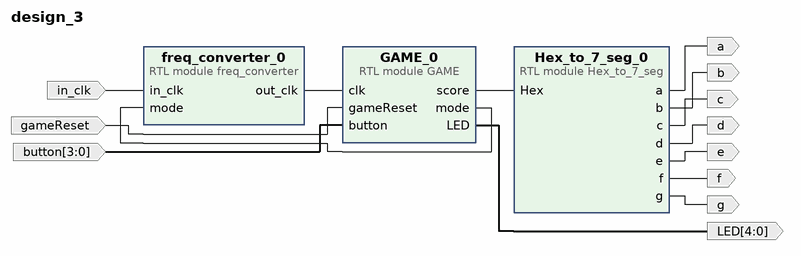
[diagram p0: block diagram of the top level]
# Vivado block design design_3, xc7z010clg400-1, Vivado 2019.1
create_bd_design design_3

create_bd_port -dir I -type clk in_clk
create_bd_port -dir O -from 4 -to 0 LED
create_bd_port -dir I gameReset
create_bd_port -dir I -from 3 -to 0 button
create_bd_port -dir O a
create_bd_port -dir O b
create_bd_port -dir O e
create_bd_port -dir O d
create_bd_port -dir O c
create_bd_port -dir O f
create_bd_port -dir O g

create_bd_cell -type module -reference freq_converter freq_converter_0
create_bd_cell -type module -reference GAME GAME_0
create_bd_cell -type module -reference Hex_to_7_seg Hex_to_7_seg_0

# ---- connections ----

connect_bd_net [get_bd_pins freq_converter_0/out_clk] [get_bd_pins GAME_0/clk]
connect_bd_net -net in_clk_0_1 [get_bd_ports in_clk] [get_bd_pins freq_converter_0/in_clk]
connect_bd_net [get_bd_pins GAME_0/mode] [get_bd_pins freq_converter_0/mode]
connect_bd_net [get_bd_pins GAME_0/LED] [get_bd_ports LED]
connect_bd_net -net gameReset_0_1 [get_bd_ports gameReset] [get_bd_pins GAME_0/gameReset]
connect_bd_net -net button_0_1 [get_bd_ports button] [get_bd_pins GAME_0/button]
connect_bd_net [get_bd_pins GAME_0/score] [get_bd_pins Hex_to_7_seg_0/Hex]
connect_bd_net [get_bd_pins Hex_to_7_seg_0/a] [get_bd_ports a]
connect_bd_net [get_bd_pins Hex_to_7_seg_0/b] [get_bd_ports b]
connect_bd_net [get_bd_pins Hex_to_7_seg_0/e] [get_bd_ports e]
connect_bd_net [get_bd_pins Hex_to_7_seg_0/d] [get_bd_ports d]
connect_bd_net [get_bd_pins Hex_to_7_seg_0/c] [get_bd_ports c]
connect_bd_net [get_bd_pins Hex_to_7_seg_0/f] [get_bd_ports f]
connect_bd_net [get_bd_pins Hex_to_7_seg_0/g] [get_bd_ports g]

validate_bd_design
save_bd_design
